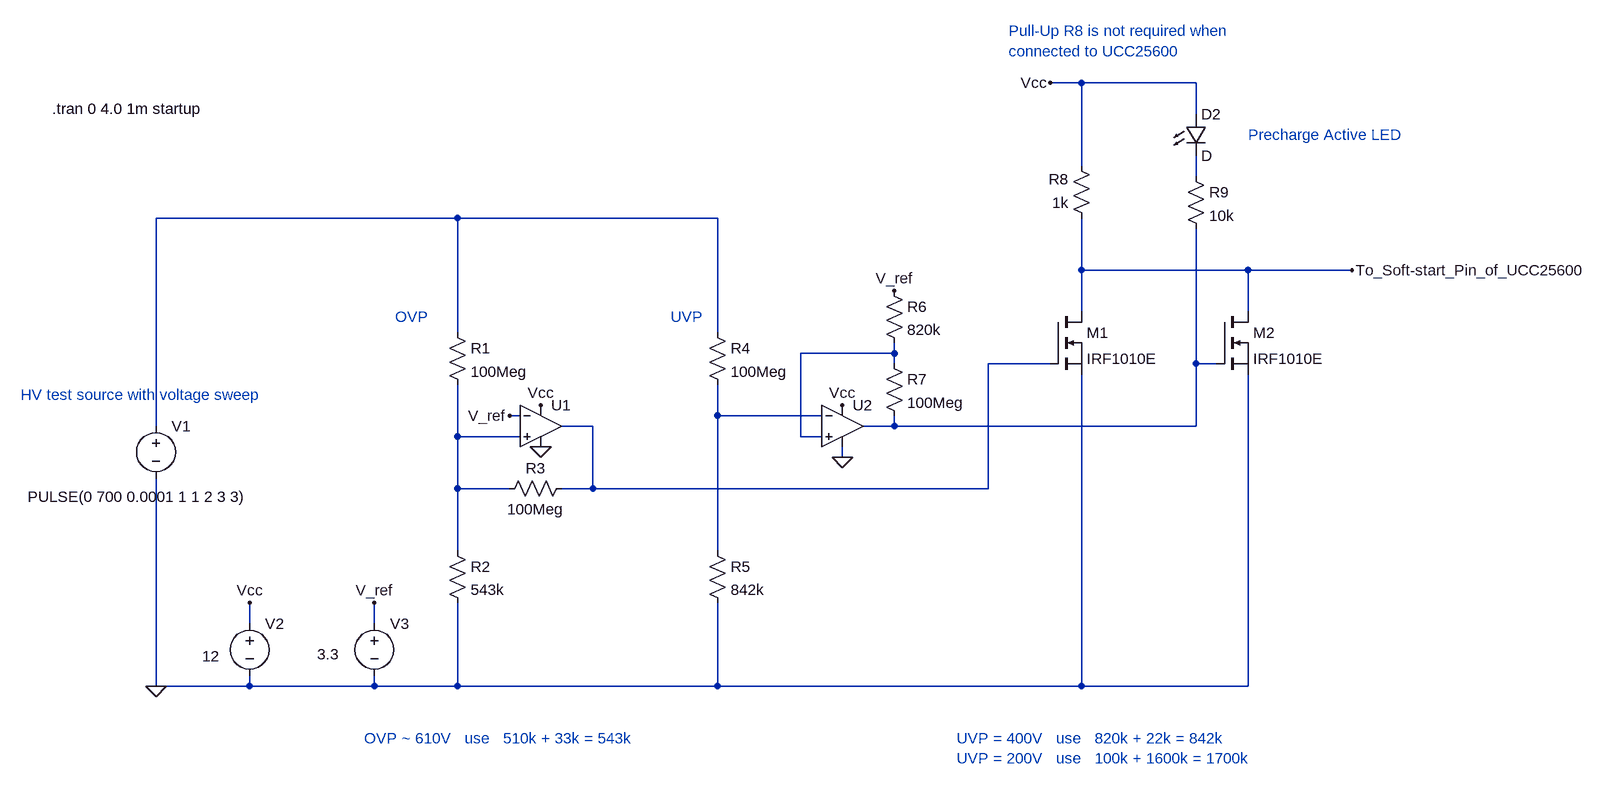
[diagram p0: schematic DCDCv9-3r_OVP_ UVP.asc]
DCDCv9-3r_OVP_ UVP.asc, the LTspice schematic file:
Version 4
SHEET 1 2184 2124
WIRE -1200 848 -1248 848
WIRE -1024 848 -1200 848
WIRE -1024 896 -1024 848
WIRE -1200 976 -1200 848
WIRE -1024 992 -1024 960
WIRE -2160 1056 -2624 1056
WIRE -1760 1056 -2160 1056
WIRE -1200 1136 -1200 1056
WIRE -944 1136 -1200 1136
WIRE -784 1136 -944 1136
WIRE -1200 1200 -1200 1136
WIRE -944 1200 -944 1136
WIRE -2160 1232 -2160 1056
WIRE -1760 1232 -1760 1056
WIRE -1488 1264 -1488 1248
WIRE -1488 1264 -1632 1264
WIRE -1488 1280 -1488 1264
WIRE -1248 1280 -1344 1280
WIRE -1024 1280 -1024 1072
WIRE -992 1280 -1024 1280
WIRE -2064 1360 -2080 1360
WIRE -1760 1360 -1760 1312
WIRE -1600 1360 -1760 1360
WIRE -2624 1376 -2624 1056
WIRE -1952 1376 -2000 1376
WIRE -1488 1376 -1488 1360
WIRE -1488 1376 -1536 1376
WIRE -1024 1376 -1024 1280
WIRE -1024 1376 -1488 1376
WIRE -2160 1392 -2160 1312
WIRE -2064 1392 -2160 1392
WIRE -1632 1392 -1632 1264
WIRE -1600 1392 -1632 1392
WIRE -1568 1424 -1568 1408
WIRE -2160 1472 -2160 1392
WIRE -2080 1472 -2160 1472
WIRE -1952 1472 -1952 1376
WIRE -1952 1472 -2000 1472
WIRE -1344 1472 -1344 1280
WIRE -1344 1472 -1952 1472
WIRE -2160 1568 -2160 1472
WIRE -1760 1568 -1760 1360
WIRE -2480 1680 -2480 1648
WIRE -2288 1680 -2288 1648
WIRE -2624 1776 -2624 1456
WIRE -2480 1776 -2480 1760
WIRE -2480 1776 -2624 1776
WIRE -2288 1776 -2288 1760
WIRE -2288 1776 -2480 1776
WIRE -2160 1776 -2160 1648
WIRE -2160 1776 -2288 1776
WIRE -1760 1776 -1760 1648
WIRE -1760 1776 -2160 1776
WIRE -1200 1776 -1200 1296
WIRE -1200 1776 -1760 1776
WIRE -944 1776 -944 1296
WIRE -944 1776 -1200 1776
FLAG -2624 1776 0
FLAG -784 1136 To_Soft-start_Pin_of_UCC25600
FLAG -2032 1408 0
FLAG -1568 1424 0
FLAG -2288 1648 V_ref
FLAG -2080 1360 V_ref
FLAG -2032 1344 Vcc
FLAG -1568 1344 Vcc
FLAG -2480 1648 Vcc
FLAG -1248 848 Vcc
FLAG -1488 1168 V_ref
SYMBOL res -1776 1216 R0
SYMATTR InstName R4
SYMATTR Value 100Meg
SYMBOL res -1776 1552 R0
SYMATTR InstName R5
SYMATTR Value 842k
SYMBOL voltage -2480 1664 R0
WINDOW 123 0 0 Left 0
WINDOW 3 -73 66 Left 2
WINDOW 39 -102 136 Left 2
SYMATTR Value 12
SYMATTR InstName V2
SYMBOL voltage -2624 1360 R0
WINDOW 123 0 0 Left 0
WINDOW 3 -197 125 Left 2
WINDOW 39 -134 60 Left 2
SYMATTR Value PULSE(0 700 0.0001 1 1 2 3 3)
SYMATTR InstName V1
SYMBOL OpAmps/UniversalOpamp2 -2032 1376 R0
SYMATTR InstName U1
SYMBOL res -2176 1216 R0
SYMATTR InstName R1
SYMATTR Value 100Meg
SYMBOL res -2176 1552 R0
SYMATTR InstName R2
SYMATTR Value 543k
SYMBOL voltage -2288 1664 R0
WINDOW 123 0 0 Left 0
WINDOW 3 -88 63 Left 2
WINDOW 39 -102 136 Left 2
SYMATTR Value 3.3
SYMATTR InstName V3
SYMBOL res -1984 1456 R90
WINDOW 0 0 56 VBottom 2
WINDOW 3 32 56 VTop 2
SYMATTR InstName R3
SYMATTR Value 100Meg
SYMBOL res -1504 1152 R0
SYMATTR InstName R6
SYMATTR Value 820k
SYMBOL res -1504 1264 R0
SYMATTR InstName R7
SYMATTR Value 100Meg
SYMBOL OpAmps/UniversalOpamp2 -1568 1376 R0
SYMATTR InstName U2
SYMBOL nmos -1248 1200 R0
SYMATTR InstName M1
SYMATTR Value IRF1010E
SYMBOL res -1184 1072 R180
WINDOW 0 36 76 Left 2
WINDOW 3 36 40 Left 2
SYMATTR InstName R8
SYMATTR Value 1k
SYMBOL Res -1040 976 R0
SYMATTR InstName R9
SYMATTR Value 10k
SYMBOL nmos -992 1200 R0
SYMATTR InstName M2
SYMATTR Value IRF1010E
SYMBOL LED -1040 896 R0
SYMATTR InstName D2
TEXT -2784 888 Left 2 !.tran 0 4.0 1m startup
TEXT -1832 1208 Left 2 ;UVP
TEXT -2256 1208 Left 2 ;OVP
TEXT -1392 1856 Left 2 ;UVP = 400V   use   820k + 22k = 842k\nUVP = 200V   use   100k + 1600k = 1700k
TEXT -2304 1856 Left 2 ;OVP ~ 610V   use   510k + 33k = 543k
TEXT -2832 1328 Left 2 ;HV test source with voltage sweep
TEXT -1312 768 Left 2 ;Pull-Up R8 is not required when \nconnected to UCC25600
TEXT -944 928 Left 2 ;Precharge Active LED

The netlist it stands for:
* DCDCv9-3r_OVP_ UVP.asc
R4 N002 N006 100Meg
R5 N006 0 842k
V2 Vcc 0 12
V1 N002 0 PULSE(0 700 0.0001 1 1 2 3 3)
XU1 N007 V_ref Vcc 0 N004 level.2 Avol=1Meg GBW=10Meg Slew=10Meg ilimit=25m rail=0 Vos=0 phimargin=45 en=0 enk=0 in=0 ink=0 Rin=500Meg  ; pins IN+ IN- V+ V- OUT
R1 N002 N007 100Meg
R2 N007 0 543k
V3 V_ref 0 3.3
R3 N004 N007 100Meg
R6 V_ref N003 820k
R7 N003 N005 100Meg
XU2 N003 N006 Vcc 0 N005 level.2 Avol=1Meg GBW=10Meg Slew=10Meg ilimit=25m rail=0 Vos=0 phimargin=45 en=0 enk=0 in=0 ink=0 Rin=500Meg  ; pins IN+ IN- V+ V- OUT
M1 To_Soft-start_Pin_of_UCC25600 N004 0 0 IRF1010E
R8 To_Soft-start_Pin_of_UCC25600 Vcc 1k
R9 N001 N005 10k
M2 To_Soft-start_Pin_of_UCC25600 N005 0 0 IRF1010E
D2 Vcc N001 D
.model D D
.lib standard.dio
.model NMOS NMOS
.model PMOS PMOS
.lib standard.mos
.tran 0 4.0 1m startup
* UVP
* OVP
* UVP = 400V   use   820k + 22k = 842k
* UVP = 200V   use   100k + 1600k = 1700k
* OVP ~ 610V   use   510k + 33k = 543k
* HV test source with voltage sweep
* Pull-Up R8 is not required when
* connected to UCC25600
* Precharge Active LED
.lib UniversalOpamps2.sub
.backanno
.end